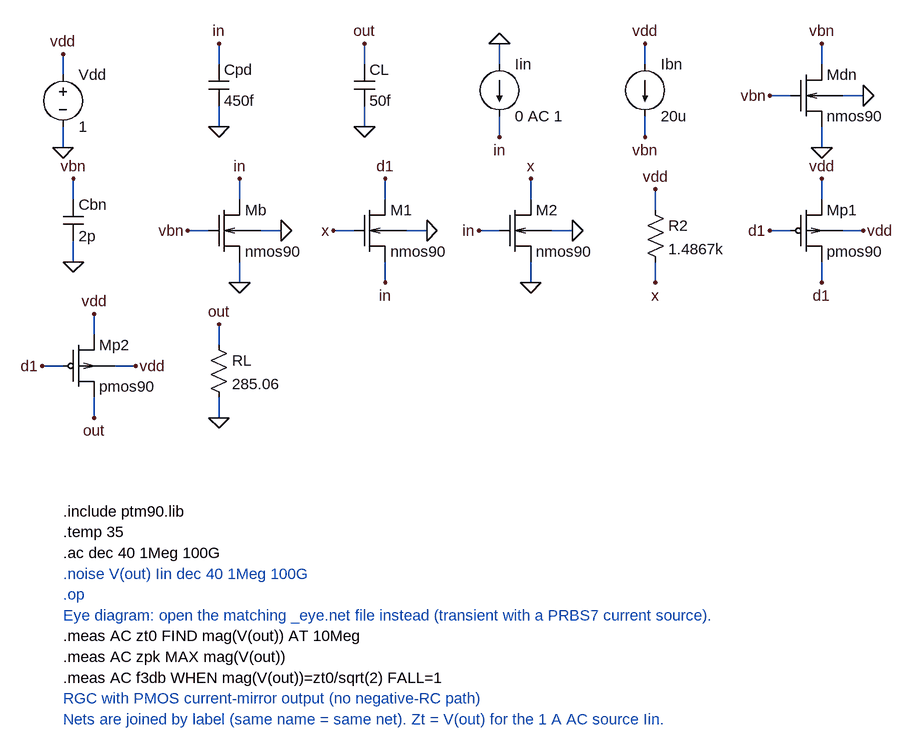
[diagram p0: schematic var_cmrgc_robust.asc]
var_cmrgc_robust.asc, the LTspice schematic file:
Version 4
SHEET 1 1600 1400
WIRE 0 16 0 -16
WIRE 0 96 0 128
WIRE 240 0 240 -32
WIRE 240 64 240 96
WIRE 464 0 464 -32
WIRE 464 64 464 96
WIRE 672 0 672 -32
WIRE 672 80 672 112
WIRE 896 0 896 -32
WIRE 896 80 896 112
WIRE 1168 0 1168 -32
WIRE 1120 48 1088 48
WIRE 1168 96 1168 128
WIRE 1200 48 1232 48
WIRE 16 208 16 176
WIRE 16 272 16 304
WIRE 272 208 272 176
WIRE 224 256 192 256
WIRE 272 304 272 336
WIRE 304 256 336 256
WIRE 496 208 496 176
WIRE 448 256 416 256
WIRE 496 304 496 336
WIRE 528 256 560 256
WIRE 720 208 720 176
WIRE 672 256 640 256
WIRE 720 304 720 336
WIRE 752 256 784 256
WIRE 912 224 912 192
WIRE 912 304 912 336
WIRE 1168 304 1168 336
WIRE 1120 256 1088 256
WIRE 1168 208 1168 176
WIRE 1200 256 1232 256
WIRE 48 512 48 544
WIRE 0 464 -32 464
WIRE 48 416 48 384
WIRE 80 464 112 464
WIRE 240 432 240 400
WIRE 240 512 240 544
FLAG 0 -16 vdd
FLAG 0 128 0
FLAG 240 -32 in
FLAG 240 96 0
FLAG 464 -32 out
FLAG 464 96 0
FLAG 672 -32 0
FLAG 672 112 in
FLAG 896 -32 vdd
FLAG 896 112 vbn
FLAG 1168 -32 vbn
FLAG 1088 48 vbn
FLAG 1168 128 0
FLAG 1232 48 0
FLAG 16 176 vbn
FLAG 16 304 0
FLAG 272 176 in
FLAG 192 256 vbn
FLAG 272 336 0
FLAG 336 256 0
FLAG 496 176 d1
FLAG 416 256 x
FLAG 496 336 in
FLAG 560 256 0
FLAG 720 176 x
FLAG 640 256 in
FLAG 720 336 0
FLAG 784 256 0
FLAG 912 192 vdd
FLAG 912 336 x
FLAG 1168 336 d1
FLAG 1088 256 d1
FLAG 1168 176 vdd
FLAG 1232 256 vdd
FLAG 48 544 out
FLAG -32 464 d1
FLAG 48 384 vdd
FLAG 112 464 vdd
FLAG 240 400 out
FLAG 240 544 0
SYMBOL voltage 0 0 R0
SYMATTR InstName Vdd
SYMATTR Value 1
SYMBOL cap 224 0 R0
SYMATTR InstName Cpd
SYMATTR Value 450f
SYMBOL cap 448 0 R0
SYMATTR InstName CL
SYMATTR Value 50f
SYMBOL current 672 0 R0
SYMATTR InstName Iin
SYMATTR Value 0 AC 1
SYMBOL current 896 0 R0
SYMATTR InstName Ibn
SYMATTR Value 20u
SYMBOL tia_nmos4 1120 0 R0
SYMATTR InstName Mdn
SYMATTR Value nmos90
SYMATTR Value2 l=200n w=1u ad=0.2p as=0.2p pd=2.4u ps=2.4u
SYMBOL cap 0 208 R0
SYMATTR InstName Cbn
SYMATTR Value 2p
SYMBOL tia_nmos4 224 208 R0
SYMATTR InstName Mb
SYMATTR Value nmos90
SYMATTR Value2 l=200n w=17.06u ad=3.413p as=3.413p pd=34.53u ps=34.53u
SYMBOL tia_nmos4 448 208 R0
SYMATTR InstName M1
SYMATTR Value nmos90
SYMATTR Value2 l=100n w=27.2u ad=5.44p as=5.44p pd=54.8u ps=54.8u
SYMBOL tia_nmos4 672 208 R0
SYMATTR InstName M2
SYMATTR Value nmos90
SYMATTR Value2 l=100n w=20.18u ad=4.035p as=4.035p pd=40.75u ps=40.75u
SYMBOL res 896 208 R0
SYMATTR InstName R2
SYMATTR Value 1.4867k
SYMBOL tia_pmos4 1120 208 R0
SYMATTR InstName Mp1
SYMATTR Value pmos90
SYMATTR Value2 l=100n w=37.34u ad=7.468p as=7.468p pd=75.08u ps=75.08u
SYMBOL tia_pmos4 0 416 R0
SYMATTR InstName Mp2
SYMATTR Value pmos90
SYMATTR Value2 l=100n w=38.84u ad=7.769p as=7.769p pd=78.09u ps=78.09u
SYMBOL res 224 416 R0
SYMATTR InstName RL
SYMATTR Value 285.06
TEXT 0 688 Left 2 !.include ptm90.lib
TEXT 0 720 Left 2 !.temp 35
TEXT 0 752 Left 2 !.ac dec 40 1Meg 100G
TEXT 0 784 Left 2 ;.noise V(out) Iin dec 40 1Meg 100G
TEXT 0 816 Left 2 ;.op
TEXT 0 848 Left 2 ;Eye diagram: open the matching _eye.net file instead (transient with a PRBS7 current source).
TEXT 0 880 Left 2 !.meas AC zt0 FIND mag(V(out)) AT 10Meg
TEXT 0 912 Left 2 !.meas AC zpk MAX mag(V(out))
TEXT 0 944 Left 2 !.meas AC f3db WHEN mag(V(out))=zt0/sqrt(2) FALL=1
TEXT 0 976 Left 2 ;RGC with PMOS current-mirror output (no negative-RC path)
TEXT 0 1008 Left 2 ;Nets are joined by label (same name = same net). Zt = V(out) for the 1 A AC source Iin.

The netlist it stands for:
* var_cmrgc_robust.asc
Vdd vdd 0 1
Cpd in 0 450f
CL out 0 50f
Iin 0 in 0 AC 1
Ibn vdd vbn 20u
Mdn vbn vbn 0 0 nmos90 l=200n w=1u ad=0.2p as=0.2p pd=2.4u ps=2.4u
Cbn vbn 0 2p
Mb in vbn 0 0 nmos90 l=200n w=17.06u ad=3.413p as=3.413p pd=34.53u ps=34.53u
M1 d1 x in 0 nmos90 l=100n w=27.2u ad=5.44p as=5.44p pd=54.8u ps=54.8u
M2 x in 0 0 nmos90 l=100n w=20.18u ad=4.035p as=4.035p pd=40.75u ps=40.75u
R2 vdd x 1.4867k
Mp1 d1 d1 vdd vdd pmos90 l=100n w=37.34u ad=7.468p as=7.468p pd=75.08u ps=75.08u
Mp2 out d1 vdd vdd pmos90 l=100n w=38.84u ad=7.769p as=7.769p pd=78.09u ps=78.09u
RL out 0 285.06
.model NMOS NMOS
.model PMOS PMOS
.lib standard.mos
.include ptm90.lib
.temp 35
.ac dec 40 1Meg 100G
* .noise V(out) Iin dec 40 1Meg 100G
* .op
* Eye diagram: open the matching _eye.net file instead (transient with a PRBS7 current source).
.meas AC zt0 FIND mag(V(out)) AT 10Meg
.meas AC zpk MAX mag(V(out))
.meas AC f3db WHEN mag(V(out))=zt0/sqrt(2) FALL=1
* RGC with PMOS current-mirror output (no negative-RC path)
* Nets are joined by label (same name = same net). Zt = V(out) for the 1 A AC source Iin.
.backanno
.end